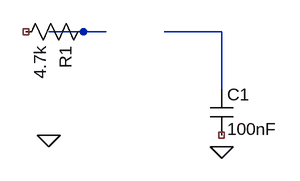
[diagram p0: schematic ltspice_filter.asc]
ltspice_filter.asc, the LTspice schematic file:
Version 4
SHEET 1 880 680
WIRE 128 96 208 96
WIRE 288 96 368 96
WIRE 368 96 368 176
FLAG 128 240 0
FLAG 368 256 0
SYMBOL res 192 80 R90
SYMATTR InstName R1
SYMATTR Value 4.7k
SYMBOL cap 352 176 R0
SYMATTR InstName C1
SYMATTR Value 100nF

The netlist it stands for:
* ltspice_filter.asc
R1 N001 NC_01 4.7k
C1 N002 NC_02 100nF
.backanno
.end